# EasyEDA Pro project Compact_4Layer_Editable.epro, board Compact PCB - routing unfinished
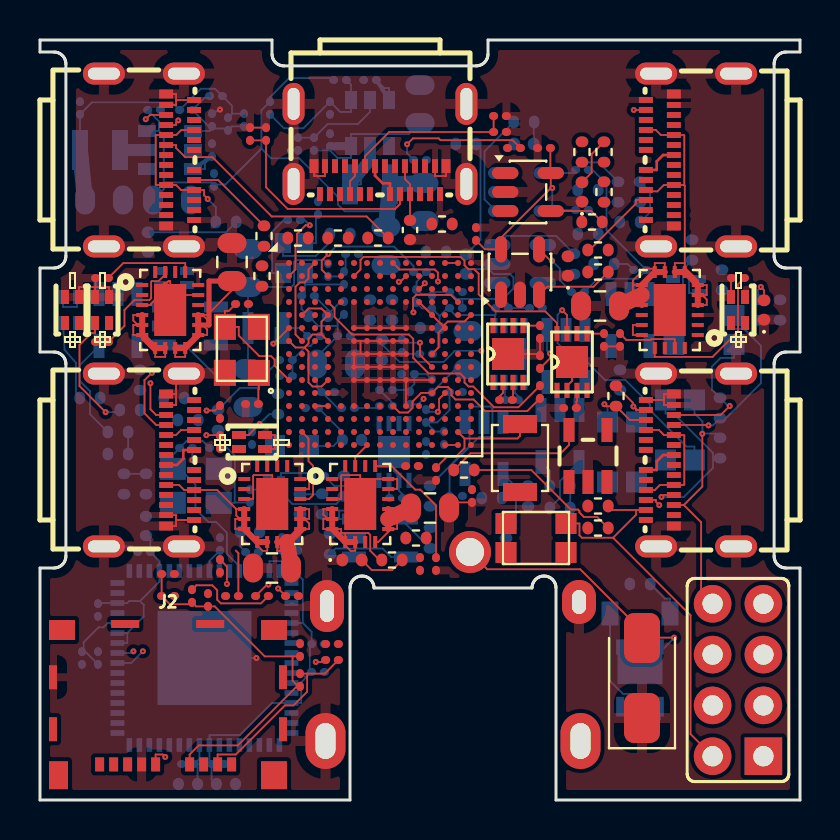
[diagram p0: board, top side]
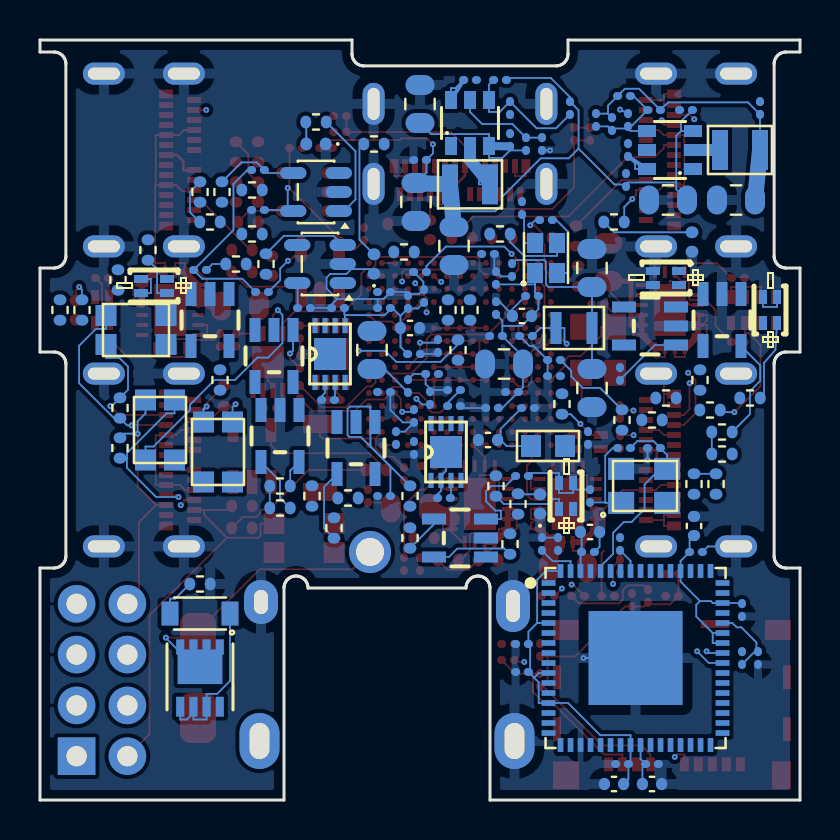
[diagram p1: board, bottom side, seen from below]

Outline 38 x 38 mm; copper layers: Top Layer, In1.Cu, In2.Cu, Bottom Layer. Coordinates in mm from the lower left corner of the outline.
Outline path: 0,38 0,37.4 0.69,37.4 0.75,37.4 0.81,37.39 0.87,37.37 0.92,37.35 0.98,37.33 1.03,37.3 1.08,37.26 1.12,37.22 1.16,37.18 1.19,37.13 1.22,37.08 1.25,37.03 1.27,36.97 1.28,36.92 1.29,36.86 1.29,36.8 1.29,27.2 1.29,27.14 1.28,27.08 1.27,27.03 1.25,26.97 1.22,26.92 1.19,26.87 1.16,26.82 1.12,26.78 1.08,26.74 1.03,26.7 0.98,26.67 0.92,26.65 0.87,26.63 0.81,26.61 0.75,26.6 0.69,26.6 0,26.6 0,22.4 0.69,22.4 0.75,22.4 0.81,22.39 0.87,22.37 0.92,22.35 0.98,22.33 1.03,22.3 1.08,22.26 1.12,22.22 1.16,22.18 1.19,22.13 1.22,22.08 1.25,22.03 1.27,21.97 1.28,21.92 1.29,21.86 1.29,21.8 1.29,12.2 1.29,12.14 1.28,12.08 1.27,12.03 1.25,11.97 1.22,11.92 1.19,11.87 1.16,11.82 1.12,11.78 1.08,11.74 1.03,11.7 0.98,11.67 0.92,11.65 0.87,11.63 0.81,11.61 0.75,11.6 0.69,11.6 0,11.6 0,0 15.5,0 15.5,10.6 15.5,10.66 15.51,10.72 15.53,10.77 15.55,10.83 15.57,10.88 15.6,10.93 15.64,10.98 15.68,11.02 15.72,11.06 15.77,11.1 15.82,11.13 15.87,11.15 15.93,11.17 15.98,11.19 16.04,11.2 16.1,11.2 16.16,11.2 16.22,11.19 16.27,11.17 16.33,11.15 16.38,11.13 16.43,11.1 16.48,11.06 16.52,11.02 16.56,10.98 16.6,10.93 16.63,10.88 16.65,10.83 16.67,10.77 16.69,10.72 16.7,10.66 16.7,10.6 24.6,10.6 24.6,10.66 24.61,10.72 24.63,10.77 24.65,10.83 24.67,10.88 24.7,10.93 24.74,10.98 24.78,11.02 24.82,11.06 24.87,11.1 24.92,11.13 24.97,11.15 25.03,11.17 25.08,11.19 25.14,11.2 25.2,11.2 25.26,11.2 25.32,11.19 25.37,11.17 25.43,11.15 25.48,11.13 25.53,11.1 25.58,11.06 25.62,11.02 25.66,10.98 25.7,10.93 25.73,10.88 25.75,10.83 25.77,10.77 25.79,10.72 25.8,10.66 25.8,10.6 25.8,0 38,0 38,11.6 37.31,11.6 37.25,11.6 37.19,11.61 37.13,11.63 37.08,11.65 37.02,11.67 36.97,11.7 36.92,11.74 36.88,11.78 36.84,11.82 36.81,11.87 36.78,11.92 36.75,11.97 36.73,12.03 36.72,12.08 36.71,12.14 36.71,12.2 36.71,21.8 36.71,21.86 36.72,21.92 36.73,21.97 36.75,22.03 36.78,22.08 36.81,22.13 36.84,22.18 36.88,22.22 36.92,22.26 36.97,22.3 37.02,22.33 37.08,22.35 37.13,22.37 37.19,22.39 37.25,22.4 37.31,22.4 38,22.4 38,26.6 37.31,26.6 37.25,26.6 37.19,26.61 37.13,26.63 37.08,26.65 37.02,26.67 36.97,26.7 36.92,26.74 36.88,26.78 36.84,26.82 36.81,26.87 36.78,26.92 36.75,26.97 36.73,27.03 36.72,27.08 36.71,27.14 36.71,27.2 36.71,36.8 36.71,36.86 36.72,36.92 36.73,36.97 36.75,37.03 36.78,37.08 36.81,37.13 36.84,37.18 36.88,37.22 36.92,37.26 36.97,37.3 37.02,37.33 37.08,37.35 37.13,37.37 37.19,37.39 37.25,37.4 37.31,37.4 38,37.4 38,38 22.4,38 22.4,37.31 22.4,37.25 22.39,37.19 22.37,37.13 22.35,37.08 22.33,37.02 22.3,36.97 22.26,36.92 22.22,36.88 22.18,36.84 22.13,36.81 22.08,36.78 22.03,36.75 21.97,36.73 21.92,36.72 21.86,36.71 21.8,36.7 12.2,36.7 12.14,36.71 12.08,36.72 12.03,36.73 11.97,36.75 11.92,36.78 11.87,36.81 11.82,36.84 11.78,36.88 11.74,36.92 11.7,36.97 11.67,37.02 11.65,37.08 11.63,37.13 11.61,37.19 11.6,37.25 11.6,37.31 11.6,38 0,38
Stack: Top Layer 0.0009mm / dielectric 1 0.0025mm 3313 er 4.1 / In1.Cu 0.0004mm / dielectric 2 0.0127mm FR4 er 4.48 / In2.Cu 0.0004mm / dielectric 3 0.0025mm 3313 er 4.1 / Bottom Layer 0.0009mm

## Design rules (mm)
net GND uses CopperRegion2
pour ie3922 uses CopperRegion
pour ie3923 uses CopperRegion1
pour ie3924 uses CopperRegion2

## Placement (name value [footprint] x y rotation side)
C1  10uF  [Compact:C1]  6.6 30 0 bottom
C2  100nF  [Compact:C2]  5.7 34.5 0 bottom
C3  10uF  [Compact:C3]  19 34.8 90 bottom
C4  100nF  [Compact:C4]  8.6 32.5 90 bottom
C5  100nF  [Compact:C5]  14.5 33 90 bottom
C6  DNP  [Compact:C6]  10.2 34 90 bottom
C7  100nF  [Compact:C7]  2 34.6 90 bottom
C8  10uF  [Compact:C8]  3.2 30 0 bottom
C9  100nF  [Compact:C9]  16.5 36 180 bottom
C10  DNP  [Compact:C10]  11.5 34.6 90 bottom
C11  100nF  [Compact:C11]  19 32 0 bottom
C12  10uF  [Compact:C12]  19.2 29.9 270 bottom
C13  10uF  [Compact:C13]  17.3 27.7 270 bottom
C14  12pF  [Compact:C14]  10.6 19.8 180 top
C15  10uF  [Compact:C15]  10.4 26.6 90 bottom
C16  100nF  [Compact:C16]  14.4 26.5 270 bottom
C17  12pF  [Compact:C17]  10.1 24.8 0 top
C18  100nF  [Compact:C18]  20.2 18.1 90 bottom
C19  10uF  [Compact:C19]  21.4 22.5 90 bottom
C20  10uF  [Compact:C20]  14.8 21.8 0 bottom
C21  10uF  [Compact:C21]  10.4 20.6 270 bottom
C22  100nF  [Compact:C22]  13.6 19.6 180 bottom
C23  100nF  [Compact:C23]  15.2 26.1 90 bottom
C24  100nF  [Compact:C24]  18.8 25.2 90 bottom
C25  220pF  [Compact:C25]  13.7 23.2 0 bottom
C26  100nF  [Compact:C26]  14.4 20.4 0 bottom
C27  100nF  [Compact:C27]  19.6 20.7 90 bottom
C28  12pF  [Compact:C28]  10.5 15.2 90 bottom
C29  10u  [Compact:C29]  18.5 28.5 270 top
C30  100nF  [Compact:C30]  13.9 6.4 180 bottom
C31  100nF  [Compact:C31]  2.9 9.5 90 bottom
C32  12pF  [Compact:C32]  7.3 17.6 0 bottom
C33  10u  [Compact:C33]  7.4 0.8 180 bottom
C34  10u  [Compact:C34]  10.5 13.4 180 bottom
C35  100nF  [Compact:C35]  7.4 1.8 0 bottom
C36  100nF  [Compact:C36]  10.6 12.4 0 bottom
C37  10u  [Compact:C37]  9.3 0.8 0 bottom
C38  100nF  [Compact:C38]  23.3 20 180 top
C39  100nF  [Compact:C39]  17.8 15.1 0 bottom
C40  100nF  [Compact:C40]  23.6 20 0 bottom
C41  100nF  [Compact:C41]  26.5 19.6 180 top
C42  100nF  [Compact:C42]  25 23.4 270 top
C43  100nF  [Compact:C43]  17.3 20.5 0 bottom
C44  100nF  [Compact:C44]  23.1 24.6 0 bottom
C45  100nF  [Compact:C45]  28.2 23 270 top
C46  100nF  [Compact:C46]  21.8 28.3 90 top
C47  100nF  [Compact:C47]  24.8 24.6 180 bottom
C48  100nF  [Compact:C48]  27.1 29.5 0 bottom
C49  100nF  [Compact:C49]  25.2 32.6 180 top
C50  10u  [Compact:C50]  9.6 26.9 90 top
C51  10u  [Compact:C51]  11.6 11.6 180 top
C52  10u  [Compact:C52]  28 24.7 180 top
C53  10u  [Compact:C53]  19.5 14.6 0 top
C54  100nF  [Compact:C54]  15.2 24.6 90 bottom
C55  100nF  [Compact:C55]  19.6 24.9 90 bottom
C56  100nF  [Compact:C56]  15.2 23.2 0 bottom
C57  100nF  [Compact:C57]  19.3 22.3 180 bottom
C58  100nF  [Compact:C58]  15.4 19.6 0 bottom
C59  100nF  [Compact:C59]  17.3 19.7 180 bottom
C60  100nF  [Compact:C60]  13.9 7.8 0 bottom
C61  100nF  [Compact:C61]  8.9 1.8 0 bottom
C62  100nF  [Compact:C62]  5.2 12.4 180 bottom
C63  100nF  [Compact:C63]  9 12.8 90 bottom
C64  100nF  [Compact:C64]  12.1 12.8 90 bottom
C65  1uF  [Compact:C65]  15.6 18 0 bottom
C66  100nF  [Compact:C66]  13.4 25.2 0 bottom
C67  1uF  [Compact:C67]  13.9 24.2 0 bottom
C68  100nF  [Compact:C68]  20.8 24.6 0 bottom
C69  1uF  [Compact:C69]  19.5 23.6 180 bottom
C70  1uF  [Compact:C70]  5.3 13.7 90 bottom
D1  SMAJ16CA-13-F  [Compact:D1]  30.1 6.1 90 top
D2  DIODEDB2W40100L  [Compact:D2]  30 9.32 90 bottom
J1  KLDHCX-MM-0202-ATR  [Compact:J1]  20.65 0 0 top
J2  MEM2085-00-115-00-A  [Compact:J2]  6.4 8.8 0 top
J3  USB4081-03-A  [Compact:J3]  17 32.55 180 top
J4  CAN  [Compact:J4]  34.9 6 90 top
J5  USB4081-03-A  [Compact:J5]  5.45 32 270 top
J6  USB4081-03-A  [Compact:J6]  5.45 17 270 top
J7  USB4081-03-A  [Compact:J7]  32.55 32 90 top
J8  USB4081-03-A  [Compact:J8]  32.55 17 90 top
L1  3u3  [Compact:L1]  3 32.5 180 bottom
L2  3u3  [Compact:L2]  16.5 30.78 0 bottom
L3  L-US-L2  [Compact:L3]  12.6 17.7 0 bottom
L4  2u2  [Compact:L4]  11.3 23.6 0 bottom
L5  ACT1210D_CHOKE  [Compact:L5]  24.8 13.1 0 top
L6  ACT1210D_CHOKE  [Compact:L6]  29.1 17.4 90 bottom
L7  ACT1210D_CHOKE  [Compact:L7]  33.2 23.5 0 bottom
L8  ACT1210D_CHOKE  [Compact:L8]  32 18.5 90 bottom
LED1  CREE-RGB-CLMVC  [Compact:LED1]  12.7 27.1 90 bottom
LED2  CAN0  [Compact:LED2]  26.4 26.7 90 top
LED3  CAN1  [Compact:LED3]  21.3 26.8 90 bottom
LED4  CAN2  [Compact:LED4]  24.2 32.8 0 bottom
LED5  CAN3  [Compact:LED5]  27.1 30.4 90 top
LED6  CH1_PWR  [Compact:LED6]  5.4 27.9 90 bottom
LED7  CH1_PWR  [Compact:LED7]  13 14.8 90 bottom
LED8  CH1_PWR  [Compact:LED8]  36.2 24.5 90 top
LED9  CH1_PWR  [Compact:LED9]  15.6 12 0 top
LED10  HSMF-C163  [Compact:LED10]  3.1 24.5 90 top
LED11  HSMF-C163  [Compact:LED11]  1.6 24.5 90 top
LED12  HSMF-C163  [Compact:LED12]  11.7 15.2 90 bottom
LED13  HSMF-C163  [Compact:LED13]  34.9 24.5 90 top
LED14  HSMF-C163  [Compact:LED14]  6.7 26.1 0 bottom
LED15  HSMF-C163  [Compact:LED15]  1.5 24.5 90 bottom
LED16  HSMF-C163  [Compact:LED16]  10.6 17.9 0 top
LED17  HSMF-C163  [Compact:LED17]  32.3 25.7 0 bottom
Q1  SIS427-VI  [Compact:Q1]  30 6.16 90 bottom
Q2  NFET-DUAL-COMMON-SOURCE-QS5K2  [Compact:Q2]  17 13.1 90 bottom
Q3  NFET-DUAL-COMMON-SOURCE-QS5K2  [Compact:Q3]  26.3 22.2 0 bottom
Q4  NFET-DUAL-COMMON-SOURCE-QS5K2  [Compact:Q4]  22.2 17.6 0 bottom
Q5  NFET-DUAL-COMMON-SOURCE-QS5K2  [Compact:Q5]  7.5 23.7 90 bottom
Q6  NFET-DUAL-COMMON-SOURCE-QS5K2  [Compact:Q6]  27.4 17.2 0 top
Q7  NFET-DUAL-COMMON-SOURCE-QS5K2  [Compact:Q7]  26 18.2 0 bottom
Q8  NFET-DUAL-COMMON-SOURCE-QS5K2  [Compact:Q8]  29.5 24 0 bottom
Q9  NFET-DUAL-COMMON-SOURCE-QS5K2  [Compact:Q9]  3.9 24 0 bottom
R1  10k  [Compact:R1]  8.7 31 90 bottom
R2  1k  [Compact:R2]  30 10.8 0 bottom
R3  10k  [Compact:R3]  8.6 34 90 bottom
R4  100k  [Compact:R4]  7.3 34.5 0 bottom
R5  100k  [Compact:R5]  9.4 33.8 270 bottom
R6  100k  [Compact:R6]  8.8 35.2 180 bottom
R7  10k  [Compact:R7]  13.7 32.8 90 bottom
R8  10k  [Compact:R8]  12.9 32.8 270 bottom
R9  10k  [Compact:R9]  14.5 34.6 270 bottom
R10  52k3  [Compact:R10]  15 36 180 bottom
R11  10k  [Compact:R11]  25 20.4 90 top
R12  10k  [Compact:R12]  19.8 16.3 90 top
R13  100k  [Compact:R13]  18.8 13.1 0 top
R14  100k  [Compact:R14]  7.4 19 0 bottom
R15  100k  [Compact:R15]  14.9 28.1 0 top
R16  100k  [Compact:R16]  22.6 15.1 0 bottom
R17  100k  [Compact:R17]  12.9 28.1 0 top
R18  100k  [Compact:R18]  20.1 28.8 0 top
R19  100k  [Compact:R19]  11.2 28.2 90 top
R20  100k  [Compact:R20]  16.9 28.1 0 top
R21  1k  [Compact:R21]  12.7 29 0 bottom
R22  2k7  [Compact:R22]  15 28.3 0 bottom
R23  1k  [Compact:R23]  13.9 29.6 90 bottom
R24  100k  [Compact:R24]  2.9 7.1 90 bottom
R25  100k  [Compact:R25]  2.1 7.1 90 bottom
R26  1M  [Compact:R26]  8.8 17.6 0 bottom
R27  12k  [Compact:R27]  12.9 12.8 270 bottom
R28  10k  [Compact:R28]  9 19.4 90 top
R29  10k  [Compact:R29]  8.4 10 90 top
R30  10k  [Compact:R30]  9 17.9 90 top
R31  10k  [Compact:R31]  11.3 33.3 90 top
R32  10k  [Compact:R32]  10.5 33.3 90 top
R33  10k  [Compact:R33]  6.4 10.2 0 top
R34  10k  [Compact:R34]  6.4 11.3 0 top
R35  10k  [Compact:R35]  13 7.5 90 top
R36  10k  [Compact:R36]  13 6 90 top
R37  10k  [Compact:R37]  7.6 10.2 90 top
R38  0R  [Compact:R38]  12.6 10.2 0 top
R39  0R  [Compact:R39]  19 11.8 90 top
R40  0R  [Compact:R40]  14.6 7.8 0 top
R41  0R  [Compact:R41]  14.6 7 0 top
R42  0R  [Compact:R42]  11.1 10.2 0 top
R43  0R  [Compact:R43]  9 11.7 90 top
R44  10k  [Compact:R44]  23 33.4 0 top
R45  10k  [Compact:R45]  23 34.2 0 top
R46  60.4  [Compact:R46]  27.9 14.7 0 top
R47  60.4  [Compact:R47]  28.8 20.2 90 top
R48  60.4  [Compact:R48]  34 19.6 90 bottom
R49  60.4  [Compact:R49]  34 17.6 90 bottom
R50  10k  [Compact:R50]  27.9 26.4 0 top
R51  10k  [Compact:R51]  27.9 27.5 0 top
R52  100k  [Compact:R52]  26.9 25.4 0 bottom
R53  10k  [Compact:R53]  26.7 26.8 90 bottom
R54  10k  [Compact:R54]  28.2 26.8 0 bottom
R55  100k  [Compact:R55]  30 26.5 0 bottom
R56  10k  [Compact:R56]  27.4 30.5 0 bottom
R57  10k  [Compact:R57]  28.9 30.4 90 bottom
R58  100k  [Compact:R58]  27.1 31.5 0 bottom
R59  10k  [Compact:R59]  28.2 30.4 90 top
R60  10k  [Compact:R60]  27.6 28.9 0 top
R61  100k  [Compact:R61]  23.7 32.6 0 top
R62  2k7  [Compact:R62]  27.1 32.4 90 top
R63  2k7  [Compact:R63]  21.3 32.8 0 bottom
R64  2k7  [Compact:R64]  24.2 33.9 0 bottom
R65  2k7  [Compact:R65]  28.2 32.4 90 top
R66  28k  [Compact:R66]  3.1 26.1 0 top
R67  28k  [Compact:R67]  9.6 10.2 0 top
R68  28k  [Compact:R68]  34.9 26.1 0 top
R69  28k  [Compact:R69]  19.8 11.8 90 top
R70  33k  [Compact:R70]  3.1 22.9 0 top
R71  33k  [Compact:R71]  10.6 18.1 90 bottom
R72  33k  [Compact:R72]  29 23 90 top
R73  33k  [Compact:R73]  21.6 15.2 90 top
R74  3k3  [Compact:R74]  9.3 28.9 0 bottom
R75  3k3  [Compact:R75]  14.1 14.8 90 bottom
R76  3k3  [Compact:R76]  35.9 24.5 90 bottom
R77  3k3  [Compact:R77]  17.6 12 0 top
R78  10k  [Compact:R78]  12.3 21.2 0 bottom
R79  10k  [Compact:R79]  25 21.9 90 top
R80  10k  [Compact:R80]  20.8 15.2 0 bottom
R81  10k  [Compact:R81]  9 21.3 90 bottom
R82  100  [Compact:R82]  4.5 19.5 0 bottom
R83  100  [Compact:R83]  16.5 24.5 90 bottom
R84  100  [Compact:R84]  17.6 24.5 90 bottom
R85  100  [Compact:R85]  17.1 22.5 90 bottom
R86  100  [Compact:R86]  15.2 15.7 90 bottom
R87  100  [Compact:R87]  19.5 15.2 90 bottom
R88  100  [Compact:R88]  37 24.5 90 bottom
R89  100  [Compact:R89]  29 21 90 bottom
R90  1k  [Compact:R90]  14.5 12.8 90 bottom
R91  100  [Compact:R91]  19.5 13.1 90 bottom
R92  1k  [Compact:R92]  19.8 27.4 0 bottom
R93  100  [Compact:R93]  27.4 28.3 0 bottom
R94  1k  [Compact:R94]  24.4 15.2 90 bottom
R95  100  [Compact:R95]  23.3 13.6 90 bottom
R96  1k  [Compact:R96]  5.3 15.8 90 bottom
R97  100  [Compact:R97]  4.2 15.8 90 bottom
R98  10k  [Compact:R98]  13.9 16.2 0 bottom
R99  10k  [Compact:R99]  20.8 25.4 0 bottom
R100  10k  [Compact:R100]  19.3 17.6 90 bottom
R101  10k  [Compact:R101]  18.1 22.7 90 bottom
R102  10k  [Compact:R102]  18.5 20.1 90 bottom
R103  10k  [Compact:R103]  18.4 21.3 0 bottom
R104  10k  [Compact:R104]  12.3 22 0 bottom
R105  10k  [Compact:R105]  19 26.4 0 bottom
R106  100  [Compact:R106]  11.1 26.2 90 top
R107  100  [Compact:R107]  6.7 20.1 0 bottom
R108  100  [Compact:R108]  5 21 90 bottom
R109  100  [Compact:R109]  2.5 20.1 0 bottom
R110  100  [Compact:R110]  11.9 19.8 90 bottom
R111  100  [Compact:R111]  8.9 19 90 bottom
R112  100  [Compact:R112]  32.6 27.5 90 bottom
R113  100  [Compact:R113]  34.1 26 90 bottom
R114  1k  [Compact:R114]  21.2 16.5 0 top
R115  100  [Compact:R115]  27.9 13.6 0 top
R116  1k  [Compact:R116]  26 15.7 0 bottom
R117  100  [Compact:R117]  26 14.6 0 bottom
R118  1k  [Compact:R118]  29.5 28.9 0 bottom
R119  100  [Compact:R119]  30 30.4 90 bottom
R120  1k  [Compact:R120]  3.9 18.4 0 bottom
R121  100  [Compact:R121]  3.9 17.3 0 bottom
R122  10k  [Compact:R122]  18.6 16.7 0 top
R123  10k  [Compact:R123]  19.3 19.2 90 bottom
R124  10k  [Compact:R124]  20.8 20.4 0 bottom
R125  10k  [Compact:R125]  15.6 27.3 0 bottom
SW1  B3U-1000P  [Compact:SW1]  24 17.1 90 top
U1  AP62300TWU-7  [Compact:U1]  6.5 32.5 90 bottom
U2  AP62300WU-7  [Compact:U2]  16.5 33.85 180 bottom
U3  STM32H725IGK3  [Compact:U3]  17 22.3 0 top
U4  USB2517  [Compact:U4]  8.22 7.1 180 bottom
U5  MCP2542FDT-E/MNY  [Compact:U5]  23.4 22.3 90 top
U6  MCP2542FDT-E/MNY  [Compact:U6]  17.7 17.4 90 bottom
U7  MCP2542FDT-E/MNY  [Compact:U7]  23.5 22.3 90 bottom
U8  MCP2542FDT-E/MNY  [Compact:U8]  26.6 21.9 90 top
U9  OPA197IDBVR  [Compact:U9]  24 26.4 90 top
U10  OPA197IDBVR  [Compact:U10]  24 26.8 0 bottom
U11  OPA197IDBVR  [Compact:U11]  24.2 30.4 0 bottom
U12  OPA197IDBVR  [Compact:U12]  24.4 30.4 0 top
U13  TPS25944ARVCR  [Compact:U13]  6.51 24.5 0 top
U14  TPS25944ARVCR  [Compact:U14]  11.61 14.8 0 top
U15  TPS25944ARVCR  [Compact:U15]  31.49 24.5 180 top
U16  TPS25944ARVCR  [Compact:U16]  16.01 14.8 0 top
Y1  25MHz  [Compact:Y1]  10.09 22.51 90 top
Y2  24MHz  [Compact:Y2]  7.79 15.71 180 bottom

## Footprints (pads in the part's own frame, mm; a bottom-side part is the same pattern mirrored in y, then rotated)
Compact:C1
  rrect 1x1.45 smd: 1(-0.95,0) 2(0.95,0)
Compact:C2
  rrect 0.46x0.4 smd: 1(-0.32,0) 2(0.32,0)
Compact:C3
  rrect 1x1.45 smd: 1(-0.95,0) 2(0.95,0)
Compact:C4
  rrect 0.46x0.4 smd: 1(-0.32,0) 2(0.32,0)
Compact:C5
  rrect 0.46x0.4 smd: 1(-0.32,0) 2(0.32,0)
Compact:C6
  rrect 0.46x0.4 smd: 1(-0.32,0) 2(0.32,0)
Compact:C7
  rrect 0.46x0.4 smd: 1(-0.32,0) 2(0.32,0)
Compact:C8
  rrect 1x1.45 smd: 1(-0.95,0) 2(0.95,0)
Compact:C9
  rrect 0.46x0.4 smd: 1(-0.32,0) 2(0.32,0)
Compact:C10
  rrect 0.46x0.4 smd: 1(-0.32,0) 2(0.32,0)
Compact:C11
  rrect 0.46x0.4 smd: 1(-0.32,0) 2(0.32,0)
Compact:C12
  rrect 1x1.45 smd: 1(-0.95,0) 2(0.95,0)
Compact:C13
  rrect 1x1.45 smd: 1(-0.95,0) 2(0.95,0)
Compact:C14
  rrect 0.46x0.4 smd: 1(-0.32,0) 2(0.32,0)
Compact:C15
  rrect 1x1.45 smd: 1(-0.95,0) 2(0.95,0)
Compact:C16
  rrect 0.46x0.4 smd: 1(-0.32,0) 2(0.32,0)
Compact:C17
  rrect 0.46x0.4 smd: 1(-0.32,0) 2(0.32,0)
Compact:C18
  rrect 0.46x0.4 smd: 1(-0.32,0) 2(0.32,0)
Compact:C19
  rrect 1x1.45 smd: 1(-0.95,0) 2(0.95,0)
Compact:C20
  rrect 1x1.45 smd: 1(-0.95,0) 2(0.95,0)
Compact:C21
  rrect 1x1.45 smd: 1(-0.95,0) 2(0.95,0)
Compact:C22
  rrect 0.46x0.4 smd: 1(-0.32,0) 2(0.32,0)
Compact:C23
  rrect 0.46x0.4 smd: 1(-0.32,0) 2(0.32,0)
Compact:C24
  rrect 0.46x0.4 smd: 1(-0.32,0) 2(0.32,0)
Compact:C25
  rrect 0.46x0.4 smd: 1(-0.32,0) 2(0.32,0)
Compact:C26
  rrect 0.46x0.4 smd: 1(-0.32,0) 2(0.32,0)
Compact:C27
  rrect 0.46x0.4 smd: 1(-0.32,0) 2(0.32,0)
Compact:C28
  rrect 0.46x0.4 smd: 1(-0.32,0) 2(0.32,0)
Compact:C29
  rrect 0.56x0.62 smd: 1(-0.48,0) 2(0.48,0)
Compact:C30
  rrect 0.46x0.4 smd: 1(-0.32,0) 2(0.32,0)
Compact:C31
  rrect 0.46x0.4 smd: 1(-0.32,0) 2(0.32,0)
Compact:C32
  rrect 0.46x0.4 smd: 1(-0.32,0) 2(0.32,0)
Compact:C33
  rrect 0.56x0.62 smd: 1(-0.48,0) 2(0.48,0)
Compact:C34
  rrect 0.56x0.62 smd: 1(-0.48,0) 2(0.48,0)
Compact:C35
  rrect 0.46x0.4 smd: 1(-0.32,0) 2(0.32,0)
Compact:C36
  rrect 0.46x0.4 smd: 1(-0.32,0) 2(0.32,0)
Compact:C37
  rrect 0.56x0.62 smd: 1(-0.48,0) 2(0.48,0)
Compact:C38
  rrect 0.46x0.4 smd: 1(-0.32,0) 2(0.32,0)
Compact:C39
  rrect 0.46x0.4 smd: 1(-0.32,0) 2(0.32,0)
Compact:C40
  rrect 0.46x0.4 smd: 1(-0.32,0) 2(0.32,0)
Compact:C41
  rrect 0.46x0.4 smd: 1(-0.32,0) 2(0.32,0)
Compact:C42
  rrect 0.46x0.4 smd: 1(-0.32,0) 2(0.32,0)
Compact:C43
  rrect 0.46x0.4 smd: 1(-0.32,0) 2(0.32,0)
Compact:C44
  rrect 0.46x0.4 smd: 1(-0.32,0) 2(0.32,0)
Compact:C45
  rrect 0.46x0.4 smd: 1(-0.32,0) 2(0.32,0)
Compact:C46
  rrect 0.46x0.4 smd: 1(-0.32,0) 2(0.32,0)
Compact:C47
  rrect 0.46x0.4 smd: 1(-0.32,0) 2(0.32,0)
Compact:C48
  rrect 0.46x0.4 smd: 1(-0.32,0) 2(0.32,0)
Compact:C49
  rrect 0.46x0.4 smd: 1(-0.32,0) 2(0.32,0)
Compact:C50
  rrect 1x1.45 smd: 1(-0.95,0) 2(0.95,0)
Compact:C51
  rrect 1x1.45 smd: 1(-0.95,0) 2(0.95,0)
Compact:C52
  rrect 1x1.45 smd: 1(-0.95,0) 2(0.95,0)
Compact:C53
  rrect 1x1.45 smd: 1(-0.95,0) 2(0.95,0)
Compact:C54
  rrect 0.46x0.4 smd: 1(-0.32,0) 2(0.32,0)
Compact:C55
  rrect 0.46x0.4 smd: 1(-0.32,0) 2(0.32,0)
Compact:C56
  rrect 0.46x0.4 smd: 1(-0.32,0) 2(0.32,0)
Compact:C57
  rrect 0.46x0.4 smd: 1(-0.32,0) 2(0.32,0)
Compact:C58
  rrect 0.46x0.4 smd: 1(-0.32,0) 2(0.32,0)
Compact:C59
  rrect 0.46x0.4 smd: 1(-0.32,0) 2(0.32,0)
Compact:C60
  rrect 0.46x0.4 smd: 1(-0.32,0) 2(0.32,0)
Compact:C61
  rrect 0.46x0.4 smd: 1(-0.32,0) 2(0.32,0)
Compact:C62
  rrect 0.46x0.4 smd: 1(-0.32,0) 2(0.32,0)
Compact:C63
  rrect 0.46x0.4 smd: 1(-0.32,0) 2(0.32,0)
Compact:C64
  rrect 0.46x0.4 smd: 1(-0.32,0) 2(0.32,0)
Compact:C65
  rrect 0.56x0.62 smd: 1(-0.48,0) 2(0.48,0)
Compact:C66
  rrect 0.46x0.4 smd: 1(-0.32,0) 2(0.32,0)
Compact:C67
  rrect 0.56x0.62 smd: 1(-0.48,0) 2(0.48,0)
Compact:C68
  rrect 0.46x0.4 smd: 1(-0.32,0) 2(0.32,0)
Compact:C69
  rrect 0.56x0.62 smd: 1(-0.48,0) 2(0.48,0)
Compact:C70
  rrect 0.56x0.62 smd: 1(-0.48,0) 2(0.48,0)
Compact:D1
  rrect 2.5x1.8 smd: 1(-2,0) 2(2,0)
Compact:D2
  rect 1.2x0.85 smd: 1(0,-1.5) 2(0,1.5)
Compact:J1
  round 2.1 hole 1.4: 1(0.85,12.4)
  oval 1.7x2.6 hole 0.7x1.6: 2(-6.3,9.7)
  oval 1.7x2.2 hole 0.7x1.2: 3(6.3,9.9)
  oval 2x2.8 hole 1x1.8: SH(-6.375,2.95) SH(6.375,2.95)
Compact:J2
  rect 0.45x0.7 smd: 1(3.18,-7.02) 2(2.48,-7.02) 3(1.78,-7.02) 4(1.08,-7.02) 5(-0.62,-7.02) 6(-1.32,-7.02) 7(-2.72,-7.02) 8(-3.42,-7.02) CD(-2.02,-7.02)
  rect 0.4x1.2 smd: SH(-5.75,-2.66) SH(-5.75,-5.26) SH(5.75,-2.66) SH(5.75,-5.26)
  rect 0.95x1.4 smd: SH(-5.475,-7.56)
  rect 1.3x1 smd: SH(-5.3,-0.3) SH(5.3,-0.3)
  rect 1.4x0.4 smd: SH(-2.14,0) SH(2.11,0)
  rect 1.3x1.4 smd: SH(5.3,-7.56)
Compact:J3
  oval 1.1x2.1 hole 0.6x1.6: 1(-4.321,1.745) 2(4.321,1.745) 3(4.321,-2.256) 4(-4.321,-2.256)
  rect 0.45x0.701 smd: 5(-3.3,0.856) 6(3.3,0.856)
  rect 0.299x0.701 smd: A1(-2.999,2.256) A2(-2.499,2.256) A3(-1.999,2.256) A4(-1.498,2.256) A5(-0.998,2.256) A6(-0.498,2.256) A7(0.503,2.256) A8(1.001,2.256) A9(1.501,2.256) A10(2.002,2.256) A11(2.502,2.256) A12(3.002,2.256)
  rect 0.3x0.7 smd: B1(2.751,0.856) B2(2.251,0.856) B3(1.75,0.856) B4(1.25,0.856) B5(0.75,0.856) B6(0.249,0.856) B7(-0.249,0.856) B8(-0.75,0.856) B9(-1.25,0.856) B10(-1.75,0.856) B11(-2.251,0.856) B12(-2.751,0.856)
Compact:J4
  rect 1.879x1.879 hole 1.016: 1(-3.81,-1.27)
  round 1.879 hole 1.016: 2(-3.81,1.27) 3(-1.27,-1.27) 4(-1.27,1.27) 5(1.27,-1.27) 6(1.27,1.27) 7(3.81,-1.27) 8(3.81,1.27)
Compact:J5
  oval 1.1x2.1 hole 0.6x1.6: 1(-4.321,1.745) 2(4.321,1.745) 3(4.321,-2.256) 4(-4.321,-2.256)
  rect 0.45x0.701 smd: 5(-3.3,0.856) 6(3.3,0.856)
  rect 0.299x0.701 smd: A1(-2.999,2.256) A2(-2.499,2.256) A3(-1.999,2.256) A4(-1.498,2.256) A5(-0.998,2.256) A6(-0.498,2.256) A7(0.503,2.256) A8(1.001,2.256) A9(1.501,2.256) A10(2.002,2.256) A11(2.502,2.256) A12(3.002,2.256)
  rect 0.3x0.7 smd: B1(2.751,0.856) B2(2.251,0.856) B3(1.75,0.856) B4(1.25,0.856) B5(0.75,0.856) B6(0.249,0.856) B7(-0.249,0.856) B8(-0.75,0.856) B9(-1.25,0.856) B10(-1.75,0.856) B11(-2.251,0.856) B12(-2.751,0.856)
Compact:J6
  oval 1.1x2.1 hole 0.6x1.6: 1(-4.321,1.745) 2(4.321,1.745) 3(4.321,-2.256) 4(-4.321,-2.256)
  rect 0.45x0.701 smd: 5(-3.3,0.856) 6(3.3,0.856)
  rect 0.299x0.701 smd: A1(-2.999,2.256) A2(-2.499,2.256) A3(-1.999,2.256) A4(-1.498,2.256) A5(-0.998,2.256) A6(-0.498,2.256) A7(0.503,2.256) A8(1.001,2.256) A9(1.501,2.256) A10(2.002,2.256) A11(2.502,2.256) A12(3.002,2.256)
  rect 0.3x0.7 smd: B1(2.751,0.856) B2(2.251,0.856) B3(1.75,0.856) B4(1.25,0.856) B5(0.75,0.856) B6(0.249,0.856) B7(-0.249,0.856) B8(-0.75,0.856) B9(-1.25,0.856) B10(-1.75,0.856) B11(-2.251,0.856) B12(-2.751,0.856)
Compact:J7
  oval 1.1x2.1 hole 0.6x1.6: 1(-4.321,1.745) 2(4.321,1.745) 3(4.321,-2.256) 4(-4.321,-2.256)
  rect 0.45x0.701 smd: 5(-3.3,0.856) 6(3.3,0.856)
  rect 0.299x0.701 smd: A1(-2.999,2.256) A2(-2.499,2.256) A3(-1.999,2.256) A4(-1.498,2.256) A5(-0.998,2.256) A6(-0.498,2.256) A7(0.503,2.256) A8(1.001,2.256) A9(1.501,2.256) A10(2.002,2.256) A11(2.502,2.256) A12(3.002,2.256)
  rect 0.3x0.7 smd: B1(2.751,0.856) B2(2.251,0.856) B3(1.75,0.856) B4(1.25,0.856) B5(0.75,0.856) B6(0.249,0.856) B7(-0.249,0.856) B8(-0.75,0.856) B9(-1.25,0.856) B10(-1.75,0.856) B11(-2.251,0.856) B12(-2.751,0.856)
Compact:J8
  oval 1.1x2.1 hole 0.6x1.6: 1(-4.321,1.745) 2(4.321,1.745) 3(4.321,-2.256) 4(-4.321,-2.256)
  rect 0.45x0.701 smd: 5(-3.3,0.856) 6(3.3,0.856)
  rect 0.299x0.701 smd: A1(-2.999,2.256) A2(-2.499,2.256) A3(-1.999,2.256) A4(-1.498,2.256) A5(-0.998,2.256) A6(-0.498,2.256) A7(0.503,2.256) A8(1.001,2.256) A9(1.501,2.256) A10(2.002,2.256) A11(2.502,2.256) A12(3.002,2.256)
  rect 0.3x0.7 smd: B1(2.751,0.856) B2(2.251,0.856) B3(1.75,0.856) B4(1.25,0.856) B5(0.75,0.856) B6(0.249,0.856) B7(-0.249,0.856) B8(-0.75,0.856) B9(-1.25,0.856) B10(-1.75,0.856) B11(-2.251,0.856) B12(-2.751,0.856)
Compact:L1
  rect 0.8x2 smd: 1(-1,0) 2(1,0)
Compact:L2
  rect 0.8x2 smd: 1(-1,0) 2(1,0)
Compact:L3
  rect 1x1.1 smd: 1(-0.85,0) 2(0.85,0)
Compact:L4
  rect 0.55x1.6 smd: 1(-0.9,0) 2(0.9,0)
Compact:L5
  rect 1.05x1.05 smd: 1(-1.5,0.725) 2(-1.5,-0.725) 3(1.5,-0.725) 4(1.5,0.725)
Compact:L6
  rect 1.05x1.05 smd: 1(-1.5,0.725) 2(-1.5,-0.725) 3(1.5,-0.725) 4(1.5,0.725)
Compact:L7
  rect 1.05x1.05 smd: 1(-1.5,0.725) 2(-1.5,-0.725) 3(1.5,-0.725) 4(1.5,0.725)
Compact:L8
  rect 1.05x1.05 smd: 1(-1.5,0.725) 2(-1.5,-0.725) 3(1.5,-0.725) 4(1.5,0.725)
Compact:LED1
  rect 1x0.8 smd: U1(-0.75,0.55) U2(-0.75,-0.55) U3(0.75,-0.55) U4(0.75,0.55)
Compact:LED2
  rrect 0.59x0.64 smd: 1(-0.485,0) 2(0.485,0)
Compact:LED3
  rrect 0.59x0.64 smd: 1(-0.485,0) 2(0.485,0)
Compact:LED4
  rrect 0.59x0.64 smd: 1(-0.485,0) 2(0.485,0)
Compact:LED5
  rrect 0.59x0.64 smd: 1(-0.485,0) 2(0.485,0)
Compact:LED6
  rrect 0.59x0.64 smd: 1(-0.485,0) 2(0.485,0)
Compact:LED7
  rrect 0.59x0.64 smd: 1(-0.485,0) 2(0.485,0)
Compact:LED8
  rrect 0.59x0.64 smd: 1(-0.485,0) 2(0.485,0)
Compact:LED9
  rrect 0.59x0.64 smd: 1(-0.485,0) 2(0.485,0)
Compact:LED10
  rect 0.701x0.399 smd: 1(-0.65,0.35) 2(-0.65,-0.35) 3(0.65,0.35) 4(0.65,-0.35)
Compact:LED11
  rect 0.701x0.399 smd: 1(-0.65,0.35) 2(-0.65,-0.35) 3(0.65,0.35) 4(0.65,-0.35)
Compact:LED12
  rect 0.701x0.399 smd: 1(-0.65,0.35) 2(-0.65,-0.35) 3(0.65,0.35) 4(0.65,-0.35)
Compact:LED13
  rect 0.701x0.399 smd: 1(-0.65,0.35) 2(-0.65,-0.35) 3(0.65,0.35) 4(0.65,-0.35)
Compact:LED14
  rect 0.701x0.399 smd: 1(-0.65,0.35) 2(-0.65,-0.35) 3(0.65,0.35) 4(0.65,-0.35)
Compact:LED15
  rect 0.701x0.399 smd: 1(-0.65,0.35) 2(-0.65,-0.35) 3(0.65,0.35) 4(0.65,-0.35)
Compact:LED16
  rect 0.701x0.399 smd: 1(-0.65,0.35) 2(-0.65,-0.35) 3(0.65,0.35) 4(0.65,-0.35)
Compact:LED17
  rect 0.701x0.399 smd: 1(-0.65,0.35) 2(-0.65,-0.35) 3(0.65,0.35) 4(0.65,-0.35)
Compact:Q1
  rect 0.99x0.405 smd: 1(-1.492,0.99) 2(-1.492,0.33) 3(-1.492,-0.33) 4(-1.492,-0.99)
  rect 0.76x0.405 smd: 5(1.492,-0.99) 6(1.492,-0.33) 7(1.492,0.33) 8(1.492,0.99)
  rect 1.725x2.235 smd: 9(0.5,0)
Compact:Q2
  rect 0.55x1.2 smd: 1(-0.95,-1.3) 2(0,-1.3) 3(0.95,-1.3) 4(0.95,1.3) 5(-0.95,1.3)
Compact:Q3
  rect 0.55x1.2 smd: 1(-0.95,-1.3) 2(0,-1.3) 3(0.95,-1.3) 4(0.95,1.3) 5(-0.95,1.3)
Compact:Q4
  rect 0.55x1.2 smd: 1(-0.95,-1.3) 2(0,-1.3) 3(0.95,-1.3) 4(0.95,1.3) 5(-0.95,1.3)
Compact:Q5
  rect 0.55x1.2 smd: 1(-0.95,-1.3) 2(0,-1.3) 3(0.95,-1.3) 4(0.95,1.3) 5(-0.95,1.3)
Compact:Q6
  rect 0.55x1.2 smd: 1(-0.95,-1.3) 2(0,-1.3) 3(0.95,-1.3) 4(0.95,1.3) 5(-0.95,1.3)
Compact:Q7
  rect 0.55x1.2 smd: 1(-0.95,-1.3) 2(0,-1.3) 3(0.95,-1.3) 4(0.95,1.3) 5(-0.95,1.3)
Compact:Q8
  rect 0.55x1.2 smd: 1(-0.95,-1.3) 2(0,-1.3) 3(0.95,-1.3) 4(0.95,1.3) 5(-0.95,1.3)
Compact:Q9
  rect 0.55x1.2 smd: 1(-0.95,-1.3) 2(0,-1.3) 3(0.95,-1.3) 4(0.95,1.3) 5(-0.95,1.3)
Compact:R1
  rrect 0.46x0.4 smd: 1(-0.32,0) 2(0.32,0)
Compact:R2
  rrect 0.54x0.64 smd: 1(-0.51,0) 2(0.51,0)
Compact:R3
  rrect 0.46x0.4 smd: 1(-0.32,0) 2(0.32,0)
Compact:R4
  rrect 0.46x0.4 smd: 1(-0.32,0) 2(0.32,0)
Compact:R5
  rrect 0.46x0.4 smd: 1(-0.32,0) 2(0.32,0)
Compact:R6
  rrect 0.46x0.4 smd: 1(-0.32,0) 2(0.32,0)
Compact:R7
  rrect 0.46x0.4 smd: 1(-0.32,0) 2(0.32,0)
Compact:R8
  rrect 0.46x0.4 smd: 1(-0.32,0) 2(0.32,0)
Compact:R9
  rrect 0.46x0.4 smd: 1(-0.32,0) 2(0.32,0)
Compact:R10
  rrect 0.46x0.4 smd: 1(-0.32,0) 2(0.32,0)
Compact:R11
  rrect 0.46x0.4 smd: 1(-0.32,0) 2(0.32,0)
Compact:R12
  rrect 0.46x0.4 smd: 1(-0.32,0) 2(0.32,0)
Compact:R13
  rrect 0.54x0.64 smd: 1(-0.51,0) 2(0.51,0)
Compact:R14
  rrect 0.54x0.64 smd: 1(-0.51,0) 2(0.51,0)
Compact:R15
  rrect 0.54x0.64 smd: 1(-0.51,0) 2(0.51,0)
Compact:R16
  rrect 0.54x0.64 smd: 1(-0.51,0) 2(0.51,0)
Compact:R17
  rrect 0.54x0.64 smd: 1(-0.51,0) 2(0.51,0)
Compact:R18
  rrect 0.54x0.64 smd: 1(-0.51,0) 2(0.51,0)
Compact:R19
  rrect 0.54x0.64 smd: 1(-0.51,0) 2(0.51,0)
Compact:R20
  rrect 0.54x0.64 smd: 1(-0.51,0) 2(0.51,0)
Compact:R21
  rrect 0.46x0.4 smd: 1(-0.32,0) 2(0.32,0)
Compact:R22
  rrect 0.54x0.64 smd: 1(-0.51,0) 2(0.51,0)
Compact:R23
  rrect 0.46x0.4 smd: 1(-0.32,0) 2(0.32,0)
Compact:R24
  rrect 0.46x0.4 smd: 1(-0.32,0) 2(0.32,0)
Compact:R25
  rrect 0.46x0.4 smd: 1(-0.32,0) 2(0.32,0)
Compact:R26
  rrect 0.46x0.4 smd: 1(-0.32,0) 2(0.32,0)
Compact:R27
  rrect 0.46x0.4 smd: 1(-0.32,0) 2(0.32,0)
Compact:R28
  rrect 0.46x0.4 smd: 1(-0.32,0) 2(0.32,0)
Compact:R29
  rrect 0.46x0.4 smd: 1(-0.32,0) 2(0.32,0)
Compact:R30
  rrect 0.46x0.4 smd: 1(-0.32,0) 2(0.32,0)
Compact:R31
  rrect 0.46x0.4 smd: 1(-0.32,0) 2(0.32,0)
Compact:R32
  rrect 0.46x0.4 smd: 1(-0.32,0) 2(0.32,0)
Compact:R33
  rrect 0.46x0.4 smd: 1(-0.32,0) 2(0.32,0)
Compact:R34
  rrect 0.46x0.4 smd: 1(-0.32,0) 2(0.32,0)
Compact:R35
  rrect 0.46x0.4 smd: 1(-0.32,0) 2(0.32,0)
Compact:R36
  rrect 0.46x0.4 smd: 1(-0.32,0) 2(0.32,0)
Compact:R37
  rrect 0.46x0.4 smd: 1(-0.32,0) 2(0.32,0)
Compact:R38
  rrect 0.46x0.4 smd: 1(-0.32,0) 2(0.32,0)
Compact:R39
  rrect 0.46x0.4 smd: 1(-0.32,0) 2(0.32,0)
Compact:R40
  rrect 0.46x0.4 smd: 1(-0.32,0) 2(0.32,0)
Compact:R41
  rrect 0.46x0.4 smd: 1(-0.32,0) 2(0.32,0)
Compact:R42
  rrect 0.46x0.4 smd: 1(-0.32,0) 2(0.32,0)
Compact:R43
  rrect 0.46x0.4 smd: 1(-0.32,0) 2(0.32,0)
Compact:R44
  rrect 0.46x0.4 smd: 1(-0.32,0) 2(0.32,0)
Compact:R45
  rrect 0.46x0.4 smd: 1(-0.32,0) 2(0.32,0)
Compact:R46
  rrect 0.54x0.64 smd: 1(-0.51,0) 2(0.51,0)
Compact:R47
  rrect 0.54x0.64 smd: 1(-0.51,0) 2(0.51,0)
Compact:R48
  rrect 0.54x0.64 smd: 1(-0.51,0) 2(0.51,0)
Compact:R49
  rrect 0.54x0.64 smd: 1(-0.51,0) 2(0.51,0)
Compact:R50
  rrect 0.54x0.64 smd: 1(-0.51,0) 2(0.51,0)
Compact:R51
  rrect 0.54x0.64 smd: 1(-0.51,0) 2(0.51,0)
Compact:R52
  rrect 0.46x0.4 smd: 1(-0.32,0) 2(0.32,0)
Compact:R53
  rrect 0.54x0.64 smd: 1(-0.51,0) 2(0.51,0)
Compact:R54
  rrect 0.54x0.64 smd: 1(-0.51,0) 2(0.51,0)
Compact:R55
  rrect 0.46x0.4 smd: 1(-0.32,0) 2(0.32,0)
Compact:R56
  rrect 0.54x0.64 smd: 1(-0.51,0) 2(0.51,0)
Compact:R57
  rrect 0.54x0.64 smd: 1(-0.51,0) 2(0.51,0)
Compact:R58
  rrect 0.46x0.4 smd: 1(-0.32,0) 2(0.32,0)
Compact:R59
  rrect 0.54x0.64 smd: 1(-0.51,0) 2(0.51,0)
Compact:R60
  rrect 0.54x0.64 smd: 1(-0.51,0) 2(0.51,0)
Compact:R61
  rrect 0.46x0.4 smd: 1(-0.32,0) 2(0.32,0)
Compact:R62
  rrect 0.54x0.64 smd: 1(-0.51,0) 2(0.51,0)
Compact:R63
  rrect 0.54x0.64 smd: 1(-0.51,0) 2(0.51,0)
Compact:R64
  rrect 0.54x0.64 smd: 1(-0.51,0) 2(0.51,0)
Compact:R65
  rrect 0.54x0.64 smd: 1(-0.51,0) 2(0.51,0)
Compact:R66
  rrect 0.46x0.4 smd: 1(-0.32,0) 2(0.32,0)
Compact:R67
  rrect 0.46x0.4 smd: 1(-0.32,0) 2(0.32,0)
Compact:R68
  rrect 0.46x0.4 smd: 1(-0.32,0) 2(0.32,0)
Compact:R69
  rrect 0.46x0.4 smd: 1(-0.32,0) 2(0.32,0)
Compact:R70
  rrect 0.46x0.4 smd: 1(-0.32,0) 2(0.32,0)
Compact:R71
  rrect 0.46x0.4 smd: 1(-0.32,0) 2(0.32,0)
Compact:R72
  rrect 0.46x0.4 smd: 1(-0.32,0) 2(0.32,0)
Compact:R73
  rrect 0.46x0.4 smd: 1(-0.32,0) 2(0.32,0)
Compact:R74
  rrect 0.54x0.64 smd: 1(-0.51,0) 2(0.51,0)
Compact:R75
  rrect 0.54x0.64 smd: 1(-0.51,0) 2(0.51,0)
Compact:R76
  rrect 0.54x0.64 smd: 1(-0.51,0) 2(0.51,0)
Compact:R77
  rrect 0.54x0.64 smd: 1(-0.51,0) 2(0.51,0)
Compact:R78
  rrect 0.46x0.4 smd: 1(-0.32,0) 2(0.32,0)
Compact:R79
  rrect 0.46x0.4 smd: 1(-0.32,0) 2(0.32,0)
Compact:R80
  rrect 0.46x0.4 smd: 1(-0.32,0) 2(0.32,0)
Compact:R81
  rrect 0.46x0.4 smd: 1(-0.32,0) 2(0.32,0)
Compact:R82
  rrect 0.54x0.64 smd: 1(-0.51,0) 2(0.51,0)
Compact:R83
  rrect 0.54x0.64 smd: 1(-0.51,0) 2(0.51,0)
Compact:R84
  rrect 0.54x0.64 smd: 1(-0.51,0) 2(0.51,0)
Compact:R85
  rrect 0.54x0.64 smd: 1(-0.51,0) 2(0.51,0)
Compact:R86
  rrect 0.54x0.64 smd: 1(-0.51,0) 2(0.51,0)
Compact:R87
  rrect 0.54x0.64 smd: 1(-0.51,0) 2(0.51,0)
Compact:R88
  rrect 0.54x0.64 smd: 1(-0.51,0) 2(0.51,0)
Compact:R89
  rrect 0.54x0.64 smd: 1(-0.51,0) 2(0.51,0)
Compact:R90
  rrect 0.54x0.64 smd: 1(-0.51,0) 2(0.51,0)
Compact:R91
  rrect 0.54x0.64 smd: 1(-0.51,0) 2(0.51,0)
Compact:R92
  rrect 0.54x0.64 smd: 1(-0.51,0) 2(0.51,0)
Compact:R93
  rrect 0.54x0.64 smd: 1(-0.51,0) 2(0.51,0)
Compact:R94
  rrect 0.54x0.64 smd: 1(-0.51,0) 2(0.51,0)
Compact:R95
  rrect 0.54x0.64 smd: 1(-0.51,0) 2(0.51,0)
Compact:R96
  rrect 0.54x0.64 smd: 1(-0.51,0) 2(0.51,0)
Compact:R97
  rrect 0.54x0.64 smd: 1(-0.51,0) 2(0.51,0)
Compact:R98
  rrect 0.46x0.4 smd: 1(-0.32,0) 2(0.32,0)
Compact:R99
  rrect 0.46x0.4 smd: 1(-0.32,0) 2(0.32,0)
Compact:R100
  rrect 0.46x0.4 smd: 1(-0.32,0) 2(0.32,0)
Compact:R101
  rrect 0.46x0.4 smd: 1(-0.32,0) 2(0.32,0)
Compact:R102
  rrect 0.46x0.4 smd: 1(-0.32,0) 2(0.32,0)
Compact:R103
  rrect 0.46x0.4 smd: 1(-0.32,0) 2(0.32,0)
Compact:R104
  rrect 0.46x0.4 smd: 1(-0.32,0) 2(0.32,0)
Compact:R105
  rrect 0.46x0.4 smd: 1(-0.32,0) 2(0.32,0)
Compact:R106
  rrect 0.54x0.64 smd: 1(-0.51,0) 2(0.51,0)
Compact:R107
  rrect 0.54x0.64 smd: 1(-0.51,0) 2(0.51,0)
Compact:R108
  rrect 0.54x0.64 smd: 1(-0.51,0) 2(0.51,0)
Compact:R109
  rrect 0.54x0.64 smd: 1(-0.51,0) 2(0.51,0)
Compact:R110
  rrect 0.54x0.64 smd: 1(-0.51,0) 2(0.51,0)
Compact:R111
  rrect 0.54x0.64 smd: 1(-0.51,0) 2(0.51,0)
Compact:R112
  rrect 0.54x0.64 smd: 1(-0.51,0) 2(0.51,0)
Compact:R113
  rrect 0.54x0.64 smd: 1(-0.51,0) 2(0.51,0)
Compact:R114
  rrect 0.54x0.64 smd: 1(-0.51,0) 2(0.51,0)
Compact:R115
  rrect 0.54x0.64 smd: 1(-0.51,0) 2(0.51,0)
Compact:R116
  rrect 0.54x0.64 smd: 1(-0.51,0) 2(0.51,0)
Compact:R117
  rrect 0.54x0.64 smd: 1(-0.51,0) 2(0.51,0)
Compact:R118
  rrect 0.54x0.64 smd: 1(-0.51,0) 2(0.51,0)
Compact:R119
  rrect 0.54x0.64 smd: 1(-0.51,0) 2(0.51,0)
Compact:R120
  rrect 0.54x0.64 smd: 1(-0.51,0) 2(0.51,0)
Compact:R121
  rrect 0.54x0.64 smd: 1(-0.51,0) 2(0.51,0)
Compact:R122
  rrect 0.46x0.4 smd: 1(-0.32,0) 2(0.32,0)
Compact:R123
  rrect 0.46x0.4 smd: 1(-0.32,0) 2(0.32,0)
Compact:R124
  rrect 0.46x0.4 smd: 1(-0.32,0) 2(0.32,0)
Compact:R125
  rrect 0.46x0.4 smd: 1(-0.32,0) 2(0.32,0)
Compact:SW1
  rect 0.9x1.7 smd: 1(-1.7,0) 2(1.7,0)
Compact:U1
  rect 0.6x0.9 smd: 1(-0.95,-1.15) 2(0,-1.15) 3(0.95,-1.15) 4(0.95,1.15) 5(0,1.15) 6(-0.95,1.15)
Compact:U2
  rect 0.6x0.9 smd: 1(-0.95,-1.15) 2(0,-1.15) 3(0.95,-1.15) 4(0.95,1.15) 5(0,1.15) 6(-0.95,1.15)
Compact:U3
  round 0.3 smd: A1(-4.55,4.55) A2(-3.9,4.55) A3(-3.25,4.55) A4(-2.6,4.55) A5(-1.95,4.55) A6(-1.3,4.55) A7(-0.65,4.55) A8(0,4.55) A9(0.65,4.55) A10(1.3,4.55) A11(1.95,4.55) A12(2.6,4.55) A13(3.25,4.55) A14(3.9,4.55) A15(4.55,4.55) B1(-4.55,3.9) B2(-3.9,3.9) B3(-3.25,3.9) B4(-2.6,3.9) B5(-1.95,3.9) B6(-1.3,3.9) B7(-0.65,3.9) B8(0,3.9) B9(0.65,3.9) B10(1.3,3.9) B11(1.95,3.9) B12(2.6,3.9) B13(3.25,3.9) B14(3.9,3.9) B15(4.55,3.9) C1(-4.55,3.25) C2(-3.9,3.25) C3(-3.25,3.25) C4(-2.6,3.25) C5(-1.95,3.25) C6(-1.3,3.25) C7(-0.65,3.25) C8(0,3.25) C9(0.65,3.25) C10(1.3,3.25) C11(1.95,3.25) C12(2.6,3.25) C13(3.25,3.25) C14(3.9,3.25) C15(4.55,3.25) D1(-4.55,2.6) D2(-3.9,2.6) D3(-3.25,2.6) D4(-2.6,2.6) D5(-1.95,2.6) D6(-1.3,2.6) D7(-0.65,2.6) D8(0,2.6) D9(0.65,2.6) D10(1.3,2.6) D11(1.95,2.6) D12(2.6,2.6) D13(3.25,2.6) D14(3.9,2.6) D15(4.55,2.6) E1(-4.55,1.95) E2(-3.9,1.95) E3(-3.25,1.95) E4(-2.6,1.95) E12(2.6,1.95) E13(3.25,1.95) E14(3.9,1.95) E15(4.55,1.95) F1(-4.55,1.3) F2(-3.9,1.3) F3(-3.25,1.3) F4(-2.6,1.3) F6(-1.3,1.3) F7(-0.65,1.3) F8(0,1.3) F9(0.65,1.3) F10(1.3,1.3) F12(2.6,1.3) F13(3.25,1.3) F14(3.9,1.3) F15(4.55,1.3) G1(-4.55,0.65) G2(-3.9,0.65) G3(-3.25,0.65) G4(-2.6,0.65) G6(-1.3,0.65) G7(-0.65,0.65) G8(0,0.65) G9(0.65,0.65) G10(1.3,0.65) G12(2.6,0.65) G13(3.25,0.65) G14(3.9,0.65) G15(4.55,0.65) H1(-4.55,0) H2(-3.9,0) H3(-3.25,0) H4(-2.6,0) H6(-1.3,0) H7(-0.65,0) H8(0,0) H9(0.65,0) H10(1.3,0) H12(2.6,0) H13(3.25,0) H14(3.9,0) H15(4.55,0) J1(-4.55,-0.65) J2(-3.9,-0.65) J3(-3.25,-0.65) J4(-2.6,-0.65) J6(-1.3,-0.65) J7(-0.65,-0.65) J8(0,-0.65) J9(0.65,-0.65) J10(1.3,-0.65) J12(2.6,-0.65) J13(3.25,-0.65) J14(3.9,-0.65) J15(4.55,-0.65) K1(-4.55,-1.3) K2(-3.9,-1.3) K3(-3.25,-1.3) K4(-2.6,-1.3) K6(-1.3,-1.3) K7(-0.65,-1.3) K8(0,-1.3) K9(0.65,-1.3) K10(1.3,-1.3) K12(2.6,-1.3) K13(3.25,-1.3) K14(3.9,-1.3) K15(4.55,-1.3) L1(-4.55,-1.95) L2(-3.9,-1.95) L3(-3.25,-1.95) L4(-2.6,-1.95) L12(2.6,-1.95) L13(3.25,-1.95) L14(3.9,-1.95) L15(4.55,-1.95) M1(-4.55,-2.6) M2(-3.9,-2.6) M3(-3.25,-2.6) M4(-2.6,-2.6) M5(-1.95,-2.6) M6(-1.3,-2.6) M7(-0.65,-2.6) M8(0,-2.6) M9(0.65,-2.6) M10(1.3,-2.6) M11(1.95,-2.6) M12(2.6,-2.6) M13(3.25,-2.6) M14(3.9,-2.6) M15(4.55,-2.6) N1(-4.55,-3.25) N2(-3.9,-3.25) N3(-3.25,-3.25) N4(-2.6,-3.25) N5(-1.95,-3.25) N6(-1.3,-3.25) N7(-0.65,-3.25) N8(0,-3.25) N9(0.65,-3.25) N10(1.3,-3.25) N11(1.95,-3.25) N12(2.6,-3.25) N13(3.25,-3.25) N14(3.9,-3.25) N15(4.55,-3.25) P1(-4.55,-3.9) P2(-3.9,-3.9) P3(-3.25,-3.9) P4(-2.6,-3.9) P5(-1.95,-3.9) P6(-1.3,-3.9) P7(-0.65,-3.9) P8(0,-3.9) P9(0.65,-3.9) P10(1.3,-3.9) P11(1.95,-3.9) P12(2.6,-3.9) P13(3.25,-3.9) P14(3.9,-3.9) P15(4.55,-3.9) R1(-4.55,-4.55) R2(-3.9,-4.55) R3(-3.25,-4.55) R4(-2.6,-4.55) R5(-1.95,-4.55) R6(-1.3,-4.55) R7(-0.65,-4.55) R8(0,-4.55) R9(0.65,-4.55) R10(1.3,-4.55) R11(1.95,-4.55) R12(2.6,-4.55) R13(3.25,-4.55) R14(3.9,-4.55) R15(4.55,-4.55)
Compact:U4
  rect 0.69x0.28 smd: 1(-4.35,3.75) 2(-4.35,3.25) 3(-4.35,2.75) 4(-4.35,2.25) 5(-4.35,1.75) 6(-4.35,1.25) 7(-4.35,0.75) 8(-4.35,0.25) 9(-4.35,-0.25) 10(-4.35,-0.75) 11(-4.35,-1.25) 12(-4.35,-1.75) 13(-4.35,-2.25) 14(-4.35,-2.75) 15(-4.35,-3.25) 16(-4.35,-3.75) 33(4.35,-3.75) 34(4.35,-3.25) 35(4.35,-2.75) 36(4.35,-2.25) 37(4.35,-1.75) 38(4.35,-1.25) 39(4.35,-0.75) 40(4.35,-0.25) 41(4.35,0.25) 42(4.35,0.75) 43(4.35,1.25) 44(4.35,1.75) 45(4.35,2.25) 46(4.35,2.75) 47(4.35,3.25) 48(4.35,3.75)
  rect 0.28x0.69 smd: 17(-3.75,-4.35) 18(-3.25,-4.35) 19(-2.75,-4.35) 20(-2.25,-4.35) 21(-1.75,-4.35) 22(-1.25,-4.35) 23(-0.75,-4.35) 24(-0.25,-4.35) 25(0.25,-4.35) 26(0.75,-4.35) 27(1.25,-4.35) 28(1.75,-4.35) 29(2.25,-4.35) 30(2.75,-4.35) 31(3.25,-4.35) 32(3.75,-4.35) 49(3.75,4.35) 50(3.25,4.35) 51(2.75,4.35) 52(2.25,4.35) 53(1.75,4.35) 54(1.25,4.35) 55(0.75,4.35) 56(0.25,4.35) 57(-0.25,4.35) 58(-0.75,4.35) 59(-1.25,4.35) 60(-1.75,4.35) 61(-2.25,4.35) 62(-2.75,4.35) 63(-3.25,4.35) 64(-3.75,4.35)
  rect 4.7x4.7 smd: PAD(0,0)
Compact:U5
  rect 0.757x0.255 smd: 1(-1.42,0.75) 2(-1.42,0.25) 3(-1.42,-0.25) 4(-1.42,-0.75) 5(1.42,-0.75) 6(1.42,-0.25) 7(1.42,0.25) 8(1.42,0.75)
  rect 1.6x1.6 smd: PAD(0,0)
Compact:U6
  rect 0.757x0.255 smd: 1(-1.42,0.75) 2(-1.42,0.25) 3(-1.42,-0.25) 4(-1.42,-0.75) 5(1.42,-0.75) 6(1.42,-0.25) 7(1.42,0.25) 8(1.42,0.75)
  rect 1.6x1.6 smd: PAD(0,0)
Compact:U7
  rect 0.757x0.255 smd: 1(-1.42,0.75) 2(-1.42,0.25) 3(-1.42,-0.25) 4(-1.42,-0.75) 5(1.42,-0.75) 6(1.42,-0.25) 7(1.42,0.25) 8(1.42,0.75)
  rect 1.6x1.6 smd: PAD(0,0)
Compact:U8
  rect 0.757x0.255 smd: 1(-1.42,0.75) 2(-1.42,0.25) 3(-1.42,-0.25) 4(-1.42,-0.75) 5(1.42,-0.75) 6(1.42,-0.25) 7(1.42,0.25) 8(1.42,0.75)
  rect 1.6x1.6 smd: PAD(0,0)
Compact:U9
  rrect 1.325x0.6 smd: 1(-1.137,0.95) 2(-1.137,0) 3(-1.137,-0.95) 4(1.137,-0.95) 5(1.137,0.95)
Compact:U10
  rrect 1.325x0.6 smd: 1(-1.137,0.95) 2(-1.137,0) 3(-1.137,-0.95) 4(1.137,-0.95) 5(1.137,0.95)
Compact:U11
  rrect 1.325x0.6 smd: 1(-1.137,0.95) 2(-1.137,0) 3(-1.137,-0.95) 4(1.137,-0.95) 5(1.137,0.95)
Compact:U12
  rrect 1.325x0.6 smd: 1(-1.137,0.95) 2(-1.137,0) 3(-1.137,-0.95) 4(1.137,-0.95) 5(1.137,0.95)
Compact:U13
  rect 0.6x0.2 smd: 1(-1.4,1.25) 2(-1.4,0.75) 3(-1.4,0.25) 4(-1.4,-0.25) 5(-1.4,-0.75) 6(-1.4,-1.25) 11(1.4,-1.25) 12(1.4,-0.75) 13(1.4,-0.25) 14(1.4,0.25) 15(1.4,0.75) 16(1.4,1.25)
  rect 0.2x0.6 smd: 7(-0.75,-1.9) 8(-0.25,-1.9) 9(0.25,-1.9) 10(0.75,-1.9) 17(0.75,1.9) 18(0.25,1.9) 19(-0.25,1.9) 20(-0.75,1.9)
  rect 1.6x2.6 smd: PAD(0,0)
Compact:U14
  rect 0.6x0.2 smd: 1(-1.4,1.25) 2(-1.4,0.75) 3(-1.4,0.25) 4(-1.4,-0.25) 5(-1.4,-0.75) 6(-1.4,-1.25) 11(1.4,-1.25) 12(1.4,-0.75) 13(1.4,-0.25) 14(1.4,0.25) 15(1.4,0.75) 16(1.4,1.25)
  rect 0.2x0.6 smd: 7(-0.75,-1.9) 8(-0.25,-1.9) 9(0.25,-1.9) 10(0.75,-1.9) 17(0.75,1.9) 18(0.25,1.9) 19(-0.25,1.9) 20(-0.75,1.9)
  rect 1.6x2.6 smd: PAD(0,0)
Compact:U15
  rect 0.6x0.2 smd: 1(-1.4,1.25) 2(-1.4,0.75) 3(-1.4,0.25) 4(-1.4,-0.25) 5(-1.4,-0.75) 6(-1.4,-1.25) 11(1.4,-1.25) 12(1.4,-0.75) 13(1.4,-0.25) 14(1.4,0.25) 15(1.4,0.75) 16(1.4,1.25)
  rect 0.2x0.6 smd: 7(-0.75,-1.9) 8(-0.25,-1.9) 9(0.25,-1.9) 10(0.75,-1.9) 17(0.75,1.9) 18(0.25,1.9) 19(-0.25,1.9) 20(-0.75,1.9)
  rect 1.6x2.6 smd: PAD(0,0)
Compact:U16
  rect 0.6x0.2 smd: 1(-1.4,1.25) 2(-1.4,0.75) 3(-1.4,0.25) 4(-1.4,-0.25) 5(-1.4,-0.75) 6(-1.4,-1.25) 11(1.4,-1.25) 12(1.4,-0.75) 13(1.4,-0.25) 14(1.4,0.25) 15(1.4,0.75) 16(1.4,1.25)
  rect 0.2x0.6 smd: 7(-0.75,-1.9) 8(-0.25,-1.9) 9(0.25,-1.9) 10(0.75,-1.9) 17(0.75,1.9) 18(0.25,1.9) 19(-0.25,1.9) 20(-0.75,1.9)
  rect 1.6x2.6 smd: PAD(0,0)
Compact:Y1
  rect 1.3x1.1 smd: 1(-1.15,-0.85) 2(1.15,-0.85) 3(1.15,0.85) 4(-1.15,0.85)
Compact:Y2
  rect 1.3x1.1 smd: 1(-1.15,-0.85) 2(1.15,-0.85) 3(1.15,0.85) 4(-1.15,0.85)

## Nets
+3V3: C6.2 C7.1 C8.1 C19.1 C20.1 C23.1 C24.1 C26.1 C27.1 C30.2 C31.2 C37.1 C42.1 C43.1 C44.1 C45.1 C54.1 C55.1 C56.1 C57.1 C58.1 C59.1 C60.1 C61.1 C62.1 C63.1 C64.1 C66.1 C67.1 C68.1 C69.1 C70.1 J2.4 L1.2 L3.1 LED1.U1 R4.1 R5.1 R6.1 R11.1 R28.1 R29.1 R30.1 R33.1 R34.1 R35.1 R36.1 R37.1 SW1.1 U3.D5 U3.D11 U3.E2 U3.E4 U3.E12 U3.E15 U3.F13 U3.G1 U3.G4 U3.H12 U3.K4 U3.L12 U3.M5 U3.M9 U4.5 U4.10 U4.13 U4.24 U4.42 U4.43 U4.46 U4.52 U4.57 U4.64 U5.5 U6.5 U7.5 U8.5
+5V: C1.1 C2.1 C10.2 C11.1 C12.1 C13.1 C38.1 C39.1 C40.1 C41.1 L2.2 R1.1 R10.2 R52.2 R55.2 R58.2 R61.2 U1.3 U5.3 U6.3 U7.3 U8.3
+12V: C3.1 C5.1 C46.1 C47.1 C48.1 C49.1 C50.1 C51.1 C52.1 C53.1 D2.1 Q1.1 Q1.2 Q1.3 R7.1 U2.3 U9.5 U10.5 U11.5 U12.5 U13.9 U13.10 U13.11 U13.12 U13.13 U14.9 U14.10 U14.11 U14.12 U14.13 U15.9 U15.10 U15.11 U15.12 U15.13 U16.9 U16.10 U16.11 U16.12 U16.13
GND: C1.2 C2.2 C3.2 C5.2 C7.2 C8.2 C11.2 C12.2 C13.2 C14.2 C15.2 C16.2 C17.2 C18.2 C19.2 C20.2 C21.2 C22.2 C23.2 C24.2 C25.2 C26.2 C27.2 C28.2 C29.2 C30.1 C31.1 C32.2 C33.2 C34.2 C35.1 C36.1 C37.2 C38.2 C39.2 C40.2 C41.2 C42.2 C43.2 C44.2 C45.2 C46.2 C47.2 C48.2 C49.2 C50.2 C51.2 C52.2 C53.2 C54.2 C55.2 C56.2 C57.2 C58.2 C59.2 C60.2 C61.2 C62.2 C63.2 C64.2 C65.2 C66.2 C67.2 C68.2 C69.2 C70.2 D1.1 J1.2 J1.3 J1.SH J2.6 J2.SH J3.1 J3.2 J3.3 J3.4 J3.5 J3.6 J3.A1 J3.A12 J3.B1 J3.B12 J5.1 J5.2 J5.3 J5.4 J5.5 J5.6 J5.A1 J5.A12 J5.B1 J5.B12 J6.1 J6.2 J6.3 J6.4 J6.5 J6.6 J6.A1 J6.A12 J6.B1 J6.B12 J7.1 J7.2 J7.3 J7.4 J7.5 J7.6 J7.A1 J7.A12 J7.B1 J7.B12 J8.1 J8.2 J8.3 J8.4 J8.5 J8.6 J8.A1 J8.A12 J8.B1 J8.B12 LED2.1 LED3.1 LED4.1 LED5.1 LED6.1 LED7.1 LED8.1 LED9.1 LED10.3 LED10.4 LED11.3 LED11.4 LED12.3 LED12.4 LED13.3 LED13.4 LED14.3 LED14.4 LED15.3 LED15.4 LED16.3 LED16.4 LED17.3 LED17.4 Q2.2 Q3.2 Q4.2 Q5.2 Q6.2 Q7.2 Q8.2 Q9.2 R2.1 R3.2 R8.2 R9.2 R12.1 R25.1 R27.1 R31.2 R32.2 R44.2 R45.2 R66.1 R67.1 R68.1 R69.1 R70.1 R71.1 R72.1 R73.1 R78.2 R79.2 R80.2 R81.2 R98.1 R99.1 R100.1 R101.1 R102.2 R103.2 R104.2 R105.2 R122.1 R123.1 R124.1 R125.1 U1.1 U2.1 U3.A1 U3.A15 U3.C2 U3.D6 U3.D10 U3.E1 U3.F2 U3.F6 U3.F7 U3.F8 U3.F9 U3.F10 U3.F12 U3.G6 U3.G7 U3.G8 U3.G9 U3.G10 U3.H6 U3.H7 U3.H8 U3.H9 U3.H10 U3.J6 U3.J7 U3.J8 U3.J9 U3.J10 U3.J14 U3.K2 U3.K6 U3.K7 U3.K8 U3.K9 U3.K10 U3.K12 U3.L4 U3.M6 U3.M10 U3.N3 U3.R1 U3.R15 U4.19 U4.PAD U5.2 U5.PAD U6.2 U6.PAD U7.2 U7.PAD U8.2 U8.PAD U9.2 U10.2 U11.2 U12.2 U13.3 U13.15 U13.16 U13.PAD U14.3 U14.15 U14.16 U14.PAD U15.3 U15.15 U15.16 U15.PAD U16.3 U16.15 U16.16 U16.PAD Y1.2 Y1.4 Y2.2 Y2.4
VBUS: C29.1 J3.A4 J3.A9 J3.B4 J3.B9 R24.2
VDDA: C22.1 C65.1 L3.2 U3.M3 U3.M4
VDDLDO: C15.1 C16.1 C18.1 C21.1 L4.1 U3.A3 U3.A4 U3.A13 U3.A14 U3.G2 U3.R13 U3.R14
BTN: R12.2 SW1.2 U3.C5 U3.P14
CAN0_EN: U3.B5 U5.8
CAN0_H: J4.2 J5.A2 J6.A2 J7.A2 J8.A2 L5.4 R46.2 R50.1
CAN0_L: J4.1 J5.A3 J6.A3 J7.A3 J8.A3 L5.3 R46.1 R51.1
CAN0_RX: U3.A2 U5.4
CAN0_TX: U3.B3 U5.1
CAN1_EN: U3.A6 U6.8
CAN1_H: J4.4 J5.A11 J6.A11 J7.A11 J8.A11 L6.4 R47.2 R53.1
CAN1_L: J4.3 J5.A10 J6.A10 J7.A10 J8.A10 L6.3 R47.1 R54.1
CAN1_RX: U3.C6 U6.4
CAN1_TX: U3.A5 U6.1
CAN2_EN: U3.B8 U7.8
CAN2_H: J4.6 J5.B2 J6.B2 J7.B2 J8.B2 L7.4 R48.2 R56.1
CAN2_L: J4.5 J5.B3 J6.B3 J7.B3 J8.B3 L7.3 R48.1 R57.1
CAN2_RX: U3.C8 U7.4
CAN2_TX: U3.A8 U7.1
CAN3_EN: U3.B6 U8.8
CAN3_H: J4.8 J5.B11 J6.B11 J7.B11 J8.B11 L8.4 R49.2 R59.1
CAN3_L: J4.7 J5.B10 J6.B10 J7.B10 J8.B10 L8.3 R49.1 R60.1
CAN3_RX: U3.M15 U8.4
CAN3_TX: U3.L15 U8.1
CH1_D_N: J5.A7 J5.B7 U4.1
CH1_D_P: J5.A6 J5.B6 U4.2
CH1_IMON: R70.2 U3.R6 U13.19
CH1_PWR_EN: U3.P1 U13.14
CH1_SBU1: J5.A8 R19.2 R90.2 R91.2
CH1_SBU1_IGN: Q2.1 R78.1 R83.2 U3.C10
CH1_SBU1_RELAY: Q2.3 R82.2 R98.2 U3.A10
CH1_SBU2: J5.B8 R20.2 R114.2 R115.2
CH1_SBU2_IGN: Q6.1 R102.1 R107.2 U3.A9
CH1_SBU2_RELAY: Q6.3 R106.2 R122.2 U3.C9
CH2_D_N: J6.A7 J6.B7 U4.3
CH2_D_P: J6.A6 J6.B6 U4.4
CH2_IMON: R71.2 U3.M8 U14.19
CH2_PWR_EN: U3.P2 U14.14
CH2_SBU1: J6.A8 R15.2 R92.2 R93.2
CH2_SBU1_IGN: Q3.1 R79.1 R85.2 U3.B9
CH2_SBU1_RELAY: Q3.3 R84.2 R99.2 U3.D9
CH2_SBU2: J6.B8 R13.2 R116.2 R117.2
CH2_SBU2_IGN: Q7.1 R103.1 R109.2 U3.L14
CH2_SBU2_RELAY: Q7.3 R108.2 R123.2 U3.L13
CH3_D_N: J7.A7 J7.B7 U4.6
CH3_D_P: J7.A6 J7.B6 U4.7
CH3_IMON: R72.2 U3.N7 U15.19
CH3_PWR_EN: U3.P5 U15.14
CH3_SBU1: J7.A8 R17.2 R94.2 R95.2
CH3_SBU1_IGN: Q4.1 R80.1 R87.2 U3.J15
CH3_SBU1_RELAY: Q4.3 R86.2 R100.2 U3.J13
CH3_SBU2: J7.B8 R18.2 R118.2 R119.2
CH3_SBU2_IGN: Q8.1 R104.1 R111.2 U3.K13
CH3_SBU2_RELAY: Q8.3 R110.2 R124.2 U3.H15
CH4_D_N: J8.A7 J8.B7 U4.8
CH4_D_P: J8.A6 J8.B6 U4.9
CH4_IMON: R73.2 U3.R7 U16.19
CH4_PWR_EN: U3.P6 U16.14
CH4_SBU1: J8.A8 R16.2 R96.2 R97.2
CH4_SBU1_IGN: Q5.1 R81.1 R89.2 U3.H14
CH4_SBU1_RELAY: Q5.3 R88.2 R101.2 U3.J12
CH4_SBU2: J8.B8 R14.2 R120.2 R121.2
CH4_SBU2_IGN: Q9.1 R105.1 R113.2 U3.B4
CH4_SBU2_RELAY: Q9.3 R112.2 R125.2 U3.C4
HUB_SCL: R30.2 U3.N12 U4.41
HUB_SDA: R28.2 U3.P10 U4.40
LED_B: R23.2 U3.C3
LED_G: R22.2 U3.B2
LED_R: R21.2 U3.B1
NET-(D2-A): D2.2 Q1.4 R2.2
NET-(J1-PWR): D1.2 J1.1 Q1.5 Q1.6 Q1.7 Q1.8 Q1.9
NET-(J2-CD/DAT3): J2.2 R36.2 R41.2
NET-(J2-CLK): J2.5 R43.2
NET-(J2-CMD): J2.3 R37.2 R42.2
NET-(J2-DAT0): J2.7 R33.2 R38.2
NET-(J2-DAT1): J2.8 R34.2 R39.2
NET-(J2-DAT2): J2.1 R35.2 R40.2
NET-(J3-CC1): J3.A5 R31.1 R32.1
NET-(J3-CC2): J3.B5 R44.1 R45.1
NET-(J5-VBUS-PADA4): J5.A4 J5.A9 J5.B4 J5.B9 R74.1 U13.4 U13.5 U13.6 U13.7 U13.8
NET-(J6-VBUS-PADA4): J6.A4 J6.A9 J6.B4 J6.B9 R75.1 U14.4 U14.5 U14.6 U14.7 U14.8
NET-(J7-VBUS-PADA4): J7.A4 J7.A9 J7.B4 J7.B9 R76.1 U15.4 U15.5 U15.6 U15.7 U15.8
NET-(J8-VBUS-PADA4): J8.A4 J8.A9 J8.B4 J8.B9 R77.1 U16.4 U16.5 U16.6 U16.7 U16.8
NET-(LED1-B-): LED1.U4 R23.1
NET-(LED1-G-): LED1.U3 R22.1
NET-(LED1-R-): LED1.U2 R21.1
NET-(LED2-A): LED2.2 R62.2
NET-(LED3-A): LED3.2 R63.2
NET-(LED4-A): LED4.2 R64.2
NET-(LED5-A): LED5.2 R65.2
NET-(LED6-A): LED6.2 R74.2
NET-(LED7-A): LED7.2 R75.2
NET-(LED8-A): LED8.2 R76.2
NET-(LED9-A): LED9.2 R77.2
NET-(LED10-AG): LED10.1 R82.1
NET-(LED10-AR): LED10.2 R83.1
NET-(LED11-AG): LED11.1 R84.1
NET-(LED11-AR): LED11.2 R85.1
NET-(LED12-AG): LED12.1 R86.1
NET-(LED12-AR): LED12.2 R87.1
NET-(LED13-AG): LED13.1 R88.1
NET-(LED13-AR): LED13.2 R89.1
NET-(LED14-AG): LED14.1 R106.1
NET-(LED14-AR): LED14.2 R107.1
NET-(LED15-AG): LED15.1 R108.1
NET-(LED15-AR): LED15.2 R109.1
NET-(LED16-AG): LED16.1 R110.1
NET-(LED16-AR): LED16.2 R111.1
NET-(LED17-AG): LED17.1 R112.1
NET-(LED17-AR): LED17.2 R113.1
NET-(Q2-D1): Q2.5 R90.1
NET-(Q2-D2): Q2.4 R91.1
NET-(Q3-D1): Q3.5 R92.1
NET-(Q3-D2): Q3.4 R93.1
NET-(Q4-D1): Q4.5 R94.1
NET-(Q4-D2): Q4.4 R95.1
NET-(Q5-D1): Q5.5 R96.1
NET-(Q5-D2): Q5.4 R97.1
NET-(Q6-D1): Q6.5 R114.1
NET-(Q6-D2): Q6.4 R115.1
NET-(Q7-D1): Q7.5 R116.1
NET-(Q7-D2): Q7.4 R117.1
NET-(Q8-D1): Q8.5 R118.1
NET-(Q8-D2): Q8.4 R119.1
NET-(Q9-D1): Q9.5 R120.1
NET-(Q9-D2): Q9.4 R121.1
NET-(R62-PAD1): R62.1 U9.1
NET-(R63-PAD1): R63.1 U10.1
NET-(R64-PAD1): R64.1 U11.1
NET-(R65-PAD1): R65.1 U12.1
NET-(U1-BST): C4.1 U1.6
NET-(U1-EN): R1.2 U1.5
NET-(U1-FB): C6.1 R3.1 R4.2 R5.2 R6.2 U1.4
NET-(U1-SW): C4.2 L1.1 U1.2
NET-(U2-BST): C9.1 U2.6
NET-(U2-EN): R7.2 R8.1 U2.5
NET-(U2-FB): C10.1 R9.1 R10.1 U2.4
NET-(U2-SW): C9.2 L2.1 U2.2
NET-(U3A-PC0): R17.1 U3.L2
NET-(U3A-PC1): R18.1 U3.L3
NET-(U3A-PC2_C): R19.1 U3.N1
NET-(U3A-PC3_C): R20.1 U3.N2
NET-(U3A-PDR_ON): R11.2 U3.D4
NET-(U3A-PF7): R13.1 U3.J3
NET-(U3A-PF8): R14.1 U3.J2
NET-(U3A-PF9): R15.1 U3.J4
NET-(U3A-PF10): R16.1 U3.K3
NET-(U3A-PH0): C14.1 U3.J1 Y1.1
NET-(U3A-PH1): C17.1 U3.K1 Y1.3
NET-(U4-RBIAS): R27.2 U4.63
NET-(U4-SUSP_IND): R29.2 U4.45
NET-(U4-VBUS_DET): R24.1 R25.2 U4.44
NET-(U4-VDD18): C33.1 C35.2 U4.25
NET-(U4-VDD18PLL): C34.1 C36.2 U4.62
NET-(U4-XTAL1): C28.1 R26.2 U4.61 Y2.1
NET-(U4-XTAL2): C32.1 R26.1 U4.60 Y2.3
NET-(U5-CANH): L5.1 U5.7
NET-(U5-CANL): L5.2 U5.6
NET-(U6-CANH): L6.1 U6.7
NET-(U6-CANL): L6.2 U6.6
NET-(U7-CANH): L7.1 U7.7
NET-(U7-CANL): L7.2 U7.6
NET-(U8-CANH): L8.1 U8.7
NET-(U8-CANL): L8.2 U8.6
NET-(U9-+): R50.2 U9.3
NET-(U9--): R51.2 R52.1 U9.4
NET-(U10-+): R53.2 U10.3
NET-(U10--): R54.2 R55.1 U10.4
NET-(U11-+): R56.2 U11.3
NET-(U11--): R57.2 R58.1 U11.4
NET-(U12-+): R59.2 U12.3
NET-(U12--): R60.2 R61.1 U12.4
NET-(U13-ILIM): R66.2 U13.17
NET-(U14-ILIM): R67.2 U14.17
NET-(U15-ILIM): R68.2 U15.17
NET-(U16-ILIM): R69.2 U16.17
SD_CLK: R43.1 U3.B11
SD_CMD: R42.1 U3.B10
SD_D0: R38.1 U3.D14
SD_D1: R39.1 U3.E13
SD_D2: R40.1 U3.C12
SD_D3: R41.1 U3.C11
STM_D_N: U3.C15 U4.55
STM_D_P: U3.B15 U4.56
UNCONNECTED-(J3-RX1+-PADB11): J3.B11
UNCONNECTED-(J3-RX1--PADB10)_1: J3.B10
UNCONNECTED-(J3-RX2+-PADA11): J3.A11
UNCONNECTED-(J3-RX2--PADA10): J3.A10
UNCONNECTED-(J3-SBU1-PADA8): J3.A8
UNCONNECTED-(J3-SBU2-PADB8)_1: J3.B8
UNCONNECTED-(J3-TX1+-PADA2): J3.A2
UNCONNECTED-(J3-TX1--PADA3): J3.A3
UNCONNECTED-(J3-TX2+-PADB2)_1: J3.B2
UNCONNECTED-(J3-TX2--PADB3): J3.B3
UNCONNECTED-(J5-CC1-PADA5): J5.A5
UNCONNECTED-(J5-CC2-PADB5): J5.B5
UNCONNECTED-(J6-CC1-PADA5): J6.A5
UNCONNECTED-(J6-CC2-PADB5): J6.B5
UNCONNECTED-(J7-CC1-PADA5): J7.A5
UNCONNECTED-(J7-CC2-PADB5): J7.B5
UNCONNECTED-(J8-CC1-PADA5): J8.A5
UNCONNECTED-(J8-CC2-PADB5): J8.B5
UNCONNECTED-(U4-LED_A1_N-PAD51): U4.51
UNCONNECTED-(U4-LED_A2_N-PAD49): U4.49
UNCONNECTED-(U4-LED_A3_N-PAD47): U4.47
UNCONNECTED-(U4-LED_A4_N-PAD33): U4.33
UNCONNECTED-(U4-LED_A5_N-PAD31): U4.31
UNCONNECTED-(U4-LED_A6_N-PAD17): U4.17
UNCONNECTED-(U4-LED_A7_N-PAD15): U4.15
UNCONNECTED-(U4-LED_B1_N-PAD50): U4.50
UNCONNECTED-(U4-LED_B2_N-PAD48): U4.48
UNCONNECTED-(U4-LED_B3_N-PAD34): U4.34
UNCONNECTED-(U4-LED_B4_N-PAD32): U4.32
UNCONNECTED-(U4-LED_B5_N-PAD18): U4.18
UNCONNECTED-(U4-LED_B6_N-PAD16): U4.16
UNCONNECTED-(U4-LED_B7_N-PAD14): U4.14
UNCONNECTED-(U4-OCS1_N-PAD28): U4.28
UNCONNECTED-(U4-OCS2_N-PAD27): U4.27
UNCONNECTED-(U4-OCS3_N-PAD22): U4.22
UNCONNECTED-(U4-OCS4_N-PAD21): U4.21
UNCONNECTED-(U4-OCS5_N-PAD35): U4.35
UNCONNECTED-(U4-OCS6_N-PAD38): U4.38
UNCONNECTED-(U4-OCS7_N-PAD37): U4.37
UNCONNECTED-(U4-PRTPWR1-PAD29): U4.29
UNCONNECTED-(U4-PRTPWR2-PAD26): U4.26
UNCONNECTED-(U4-PRTPWR3-PAD23): U4.23
UNCONNECTED-(U4-PRTPWR4-PAD20): U4.20
UNCONNECTED-(U4-PRTPWR5-PAD30): U4.30
UNCONNECTED-(U4-PRTPWR6-PAD39): U4.39
UNCONNECTED-(U4-PRTPWR7-PAD36): U4.36
UNCONNECTED-(U4-USBDN5_DM-PAD11): U4.11
UNCONNECTED-(U4-USBDN5_DP-PAD12): U4.12
UNCONNECTED-(U4-USBDN6_DM-PAD53): U4.53
UNCONNECTED-(U4-USBDN6_DP-PAD54): U4.54
UNCONNECTED-(U13-DMODE-PAD1): U13.1
UNCONNECTED-(U13-DVDT-PAD18): U13.18
UNCONNECTED-(U13-FLT_N-PAD20): U13.20
UNCONNECTED-(U13-PG-PAD2): U13.2
UNCONNECTED-(U14-DMODE-PAD1): U14.1
UNCONNECTED-(U14-DVDT-PAD18): U14.18
UNCONNECTED-(U14-FLT_N-PAD20): U14.20
UNCONNECTED-(U14-PG-PAD2): U14.2
UNCONNECTED-(U15-DMODE-PAD1): U15.1
UNCONNECTED-(U15-DVDT-PAD18): U15.18
UNCONNECTED-(U15-FLT_N-PAD20): U15.20
UNCONNECTED-(U15-PG-PAD2): U15.2
UNCONNECTED-(U16-DMODE-PAD1): U16.1
UNCONNECTED-(U16-DVDT-PAD18): U16.18
UNCONNECTED-(U16-FLT_N-PAD20): U16.20
UNCONNECTED-(U16-PG-PAD2): U16.2
USB_D_N: J3.A7 J3.B7 U4.58
USB_D_P: J3.A6 J3.B6 U4.59
VLXSMPS: C25.1 L4.2 U3.F1

Pads without a net: J2 CD; U3 A7 A11 A12 B7 B12 B13 B14 C1 C7 C13 C14 D1 D2 D3 D7 D8 D12 D13 D15 E3 E14 F3 F4 F14 F15 G3 G12 G13 G14 G15 H1 H2 H3 H4 H13 K14 K15 L1 M1 M2 M7 M11 M12 M13 M14 N4 N5 N6 N8 N9 N10 N11 N13 N14 N15 P3 P4 P7 P8 P9 P11 P12 P13 P15 R2 R3 R4 R5 R8 R9 R10 R11 R12

## Via types
v1: diameter 0.3, hole 0.1, Top Layer to Bottom Layer, 46 vias

## Routing (per net, layer and track width the routed paths; a pad name or vN(x,y) marks a point on that pad's centre or on a via; arc(x,y) is an arc through that point)
+3V3: length 110.3
  Top Layer w0.09: 20.16,23.6 20.16,23.69 ; 20.16,23.6 U3.F13 ; 20.16,23.6 19.93,23.37 19.93,22.62 U3.H12 ; 20.16,23.69 20.39,23.92 21.22,23.92 U3.E15 ; 20.16,23.69 U3.E12 U3.D11 ; 12.63,7.18 12.63,5.97 12.88,5.72 ; 12.63,7.18 11.24,7.18 8.74,9.68 R29.1 7.8,9.68 R37.1 7.51,9.79 6.49,9.79 R33.1 R34.1 ; 12.63,7.18 R35.1 ; U3.G4 14.07,23.28 ; 14.07,23.28 13.63,23.28 13.43,23.07 13.43,22.83 13.22,22.62 ; 14.07,23.28 14.07,23.92 U3.E4 14.07,24.58 13.43,24.58 U3.E2 ; 12.88,5.72 9.89,2.73 7.93,2.73 7.48,2.28 J2.4 ; 12.88,5.72 12.96,5.72 R36.1 ; R11.1 24.37,19.45 22.26,19.45 21.68,20.03 20.78,20.03 20.57,20.23 20.57,20.47 20.4,20.65 19.9,20.65 U3.L12 19.59,20.36 19.06,20.36 18.62,19.92 18.62,19.6 18.4,19.38 17.97,19.38 U3.M9 ; C45.1 U8.5 ; 13.22,22.62 12.78,22.62 U3.G1 ; 13.22,22.62 13.43,22.42 13.43,20.88 13.63,20.67 14.07,20.67 U3.K4 ; U5.5 C42.1
  Bottom Layer w0.09: 20.48,24.53 C68.1 ; 20.48,24.53 20.76,24.25 22.75,24.25 22.75,24.24 ; 20.48,24.53 20.31,24.53 19.98,24.2 ; C54.1 14.88,23.96 14.88,23.7 ; 19.98,24.2 C69.1 19.98,22.66 C57.1 ; 19.98,24.2 C55.1 19.1,24.58 C24.1 ; C31.2 2.93,9.85 U4.46 4.36,9.85 4.46,9.95 5,9.95 ; C70.1 5.52,13 C62.1 5.97,11.95 U4.52 5.97,10.92 5,9.95 ; C59.1 17.62,19.86 C43.1 ; C37.1 8.58,1.04 C61.1 8.47,1.91 U4.24 8.47,3.24 9.99,3.24 11.59,4.85 U4.13 13.06,4.85 13.06,5.88 13.3,6.12 ; U4.43 4.36,8.35 ; 4.36,8.35 5.19,9.17 5.19,9.76 5,9.95 ; 4.36,8.35 4.36,8.35 4.36,7.85 U4.42 ; C44.1 22.78,24.27 22.75,24.24 ; U7.5 22.75,24.24 ; C19.1 20.77,21.55 C27.1 ; U4.5 13.14,8.85 ; C6.2 9.6,34.32 ; 9.6,34.32 R5.1 ; 9.6,34.32 9.6,34.72 R6.1 8.76,35.56 8.04,35.56 R4.1 6.6,34.88 2.6,34.88 C7.1 L1.2 2,31.35 2.25,31.1 C8.1 ; U4.10 13.06,6.35 13.06,6.35 13.3,6.12 ; 13.3,6.12 C30.2 13.49,6.49 13.49,7.71 C60.1 13.58,8.41 13.14,8.85 ; 14.88,23.7 C56.1 13.85,22.17 C20.1 13.85,20.63 C26.1 14.88,19.6 C58.1 ; 14.88,23.7 13.92,23.7 C67.1 13.08,24.54 C66.1 13.25,25.37 13.25,25.78 ; U4.57 8.47,11.95 C63.1 ; U4.64 12.71,11.45 13.14,11.02 13.14,8.85 ; LED1.U1 13.25,25.78 ; 13.25,25.78 C23.1
  Bottom Layer w0.8: L1.2 C8.1
